# Altium schematic sheet Comms-Sheet.SchDoc
size 420 x 297 mm; SheetNumber: 3; SheetTotal: 5
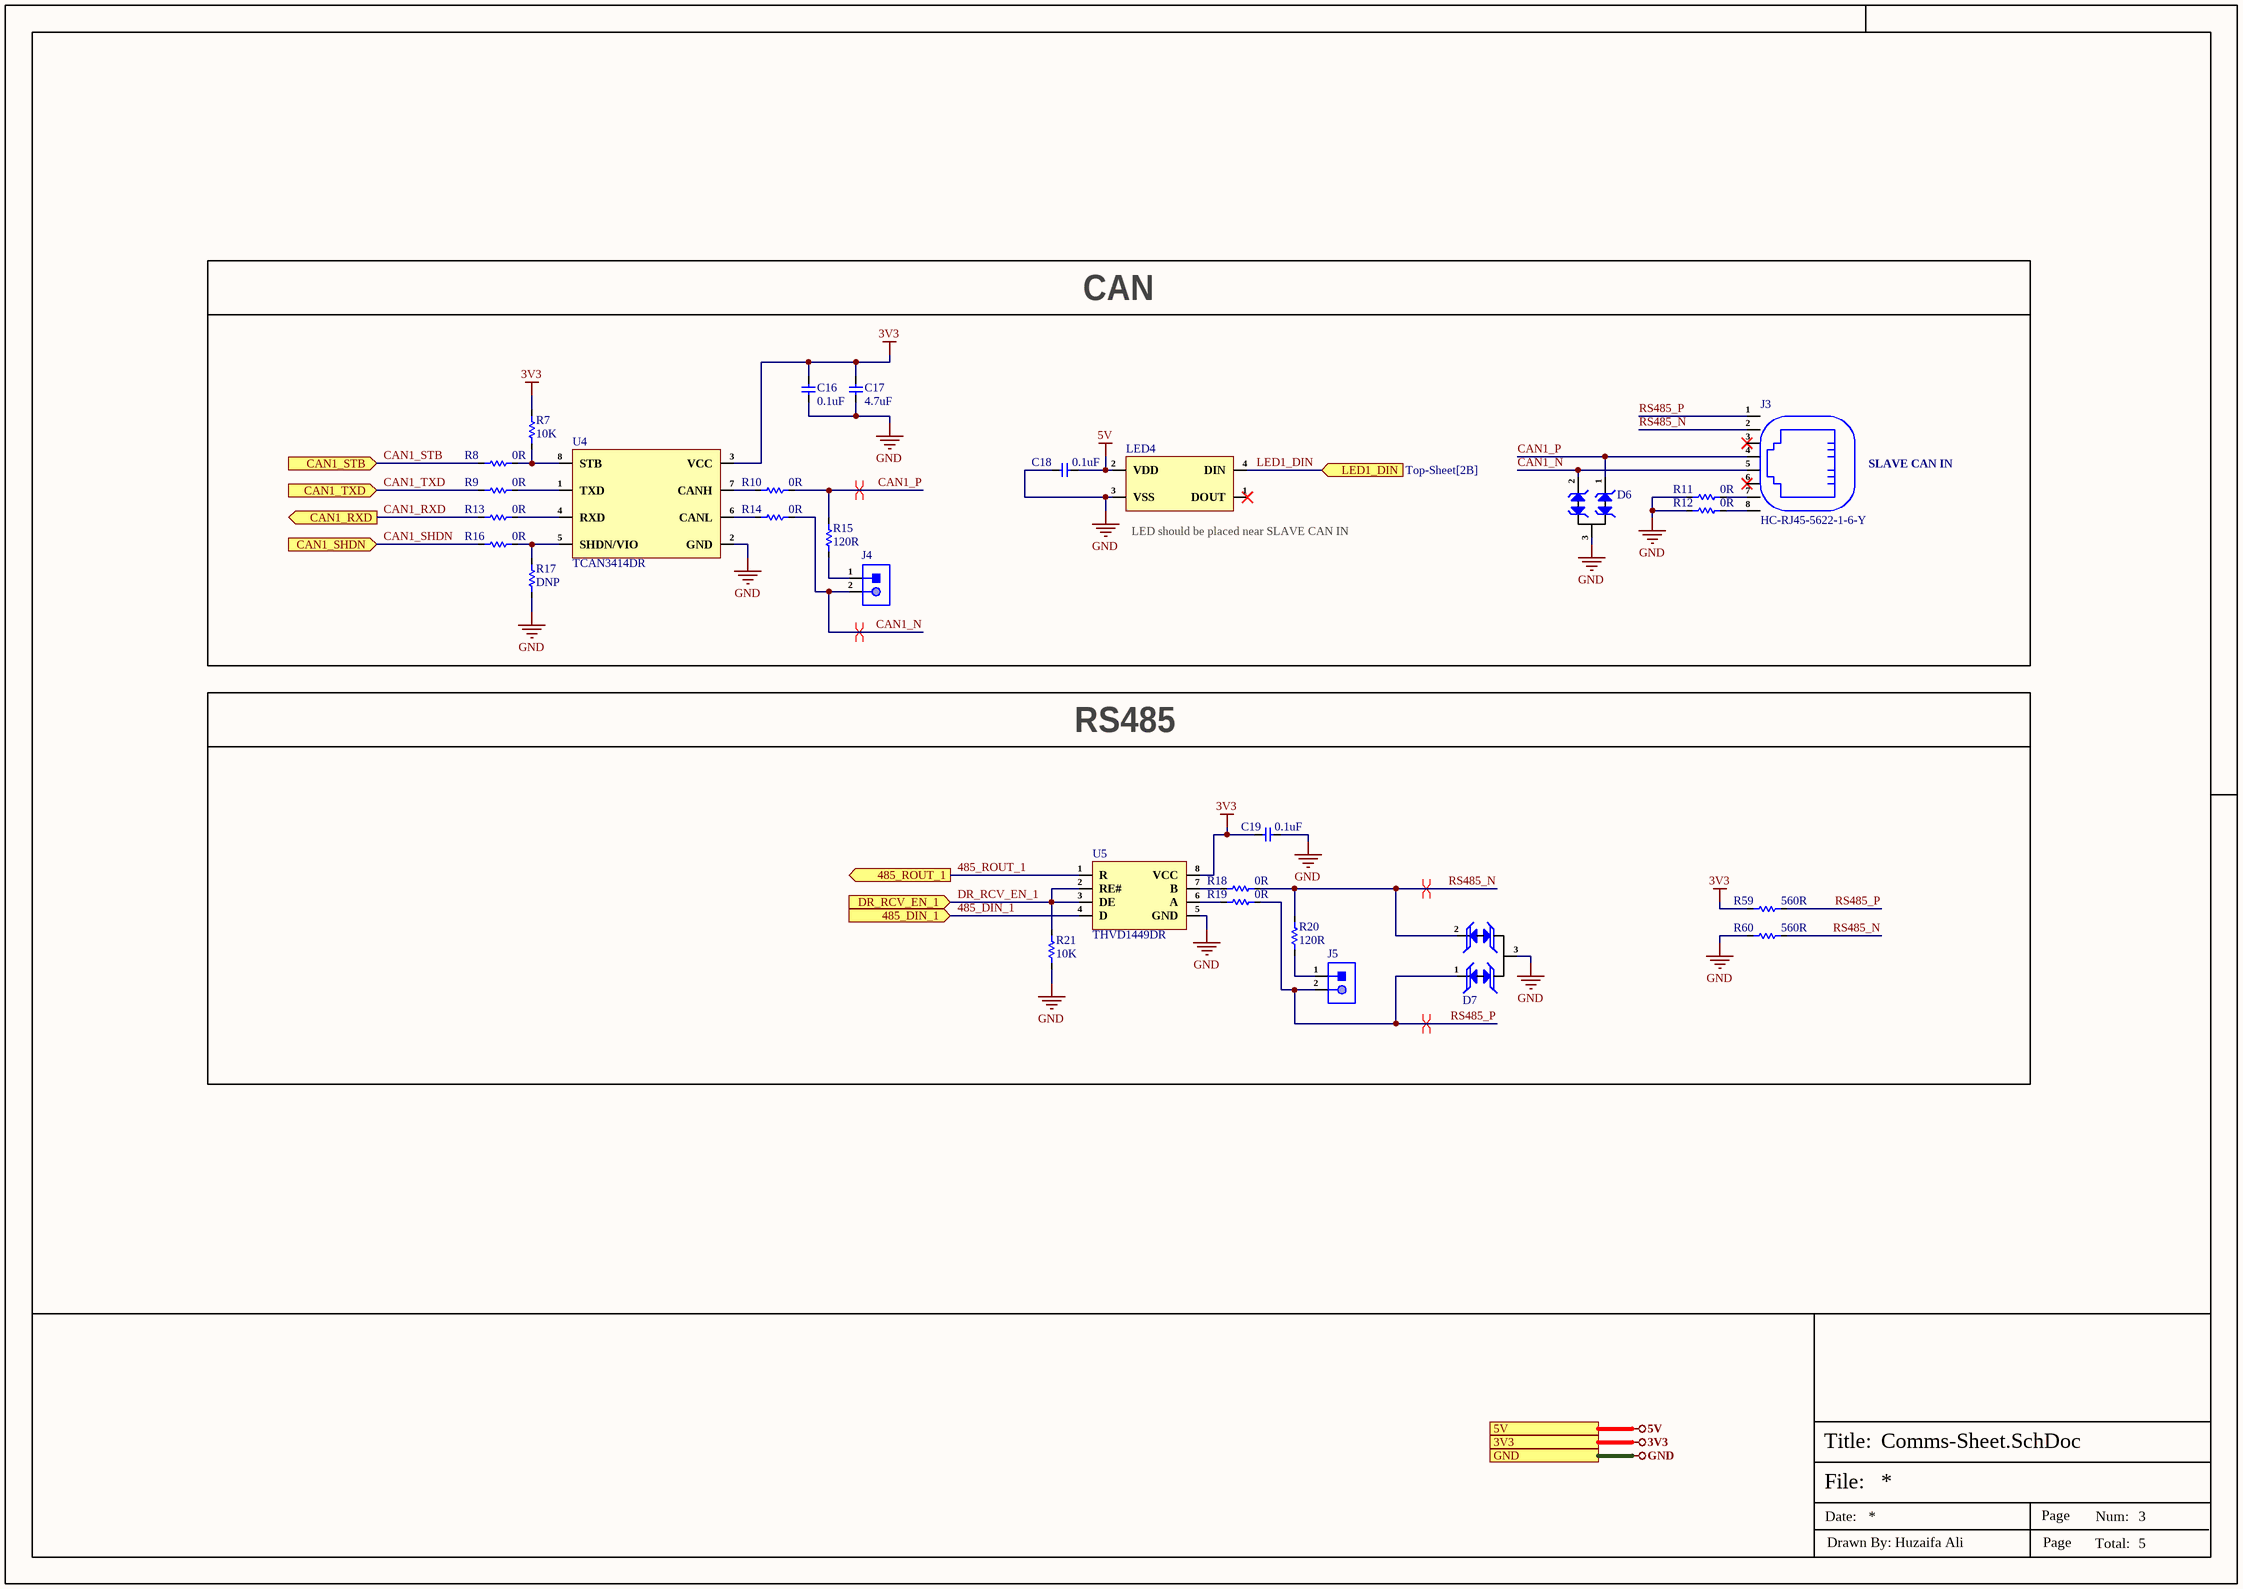
[diagram p0: Comms-Sheet.SchDoc]

## Parts
C16  0.1uF  [Cap-0402]
C17  4.7uF  [Cap-0402]
C18  0.1uF  [Cap-0402]
C19  0.1uF  [Cap-0402]
D6  CDSOT23-T24CAN-Q  [SOT-23]  (value not drawn)
D7  SM712  [SOT-23]  (value not drawn)
J3  HC-RJ45-5622-1-6-Y  [HC-RJ45-5622-1-6-Y]
J4  X6511WV-02H-C60D30  [HDR1X2_]  (value not drawn)
J5  X6511WV-02H-C60D30  [HDR1X2_]  (value not drawn)
LED4  WS2812D-F5  [WS2812D-F5]  (value not drawn)
R7  10K  [Res-0402]
R8  0R  [Res-0402]
R9  0R  [Res-0402]
R10  0R  [Res-0402]
R11  0R  [Res-0402]
R12  0R  [Res-0402]
R13  0R  [Res-0402]
R14  0R  [Res-0402]
R15  120R  [Res-0603]
R16  0R  [Res-0402]
R17  DNP  [Res-0402]
R18  0R  [Res-0402]
R19  0R  [Res-0402]
R20  120R  [Res-0603]
R21  10K  [Res-0402]
R59  560R  [Res-0402]
R60  560R  [Res-0402]
U4  TCAN3414DR  [SOIC-8(0.154", 3.90mm Width)]
U5  THVD1449DR  [SOIC-8(0.154", 3.90mm Width)]

## Blocks framed on the sheet
CAN: C16-C18 D6 J3 J4 LED4 R7-R17 U4
RS485: C19 D7 J5 R18-R21 R59 R60 U5

## Ports
3V3 (see Top-Sheet[2B], Controller-Sheet[4D], Power-Sheet[4D], Relay-10-Sheet[4D]), 5V (see Top-Sheet[2B], Controller-Sheet[4D], Power-Sheet[4D]), 485_DIN_1 (in, see Top-Sheet[2B]), 485_ROUT_1 (out, see Top-Sheet[2B]), CAN1_RXD (out, see Top-Sheet[2B]), CAN1_SHDN (in, see Top-Sheet[2B]), CAN1_STB (in, see Top-Sheet[2B]), CAN1_TXD (in, see Top-Sheet[2B]), DR_RCV_EN_1 (in, see Top-Sheet[2B]), GND (see Top-Sheet[2B], Controller-Sheet[4D], Power-Sheet[4D], Relay-10-Sheet[4D]), LED1_DIN (in, see Top-Sheet[2B])

## Nets
3V3: C16.2 C17.2 C19.2 R7.2 R59.2 U4.3(VCC) U5.8(VCC) ; port 3V3
5V: C18.2 LED4.2(VDD) ; port 5V
GND: C16.1 C17.1 C18.1 C19.1 D6.3 D7.3(GND) LED4.3(VSS) R11.1 R12.1 R17.1 R21.2 R60.2 U4.2(GND) U5.5(GND) ; port GND
485_DIN_1: U5.4(D) ; port 485_DIN_1
485_ROUT_1: U5.1(R) ; port 485_ROUT_1
CAN1_N: D6.2 J3.5 J4.2 R14.2
CAN1_P: D6.1 J3.4 R10.2 R15.2
CAN1_RXD: R13.1 ; port CAN1_RXD
CAN1_SHDN: R16.1 ; port CAN1_SHDN
CAN1_STB: R8.1 ; port CAN1_STB
CAN1_TXD: R9.1 ; port CAN1_TXD
DR_RCV_EN_1: R21.1 U5.2(RE#) U5.3(DE) ; port DR_RCV_EN_1
LED1_DIN: LED4.4(DIN) ; port LED1_DIN
RS485_N: D7.2(I/O2) J3.2 R18.2 R20.2 R60.1
RS485_P: D7.1(I/O1) J3.1 J5.2 R19.2 R59.1
NetJ3_7: J3.7 R11.2
NetJ3_8: J3.8 R12.2
NetJ4_1: J4.1 R15.1
NetJ5_1: J5.1 R20.1
NetR7_1: R7.1 R8.2 U4.8(STB)
NetR9_2: R9.2 U4.1(TXD)
NetR10_1: R10.1 U4.7(CANH)
NetR13_2: R13.2 U4.4(RXD)
NetR14_1: R14.1 U4.6(CANL)
NetR16_2: R16.2 R17.2 U4.5(SHDN/VIO)
NetR18_1: R18.1 U5.7(B)
NetR19_1: R19.1 U5.6(A)

Not connected (* = marked no-connect by the designer): J3 3* 6*; LED4 1(DOUT)*

## Layout directives
differential pair; differential pair class DIFF_RS485: RS485_N, RS485_P
differential pair; differential pair class DIFF_CAN: CAN1_N, CAN1_P

## Notes on the sheet
- SLAVE CAN IN
- (near LED4) LED should be placed near SLAVE CAN IN
- File:
- Title:
- Date:
- Page
- Num:
- Total:
- Drawn By: Huzaifa Ali

## Library data of the parts
C16 C18 C19 = CC0402JRX7R7BB104: CAP CER 0.1UF 16V X7R 0402; Manufacturer: Yageo; Material: 4241ConductorMaterial; Value: 100nF; Tolerance: 5%; Item Type: Capacitor; Supplier: Digikey; Supplier Part Number: 311-1676-1-ND; Manufacturer Part Number: CC0402JRX7R7BB104; RoHS: Yes; Category: Ceramic Capacitors; Stock: 1659111; Pricing: 1=0.1, 10=0.046, 50=0.0262, 100=0.0203, 500=0.01528, 1000=0.012, 2500=0.01091, 5000=0.01004 (USD); Mounting Technology: Surface Mount; Case/Package: 0402; Case Code (Metric): 1005; Case Code (Imperial): 0402; Min Operating Temperature: -55°C; Max Operating Temperature: 125°C; Dielectric: X7R; Packaging: Tape and Reel; Package Quantity: 10000; Voltage Rating (DC): 16V; Voltage Rating: 16V; Series: CC; Construction: Flat; Length: 0.039inch; Width: 0.02inch; Height: 0.5mm; Thickness: 0.022inch; Lead Free: Lead Free; Halogen Free: Halogen Free; RoHS Compliant: Yes; ComponentLink1URL: https://datasheet.ciiva.com/13210/upy-gphc-x7r-6-3v-to-50v-8-12304-13210152.pdf?src-supplier=Mouser; ComponentLink1Description: https://datasheet.ciiva.com/13210/upy-gphc-x7r-6-3v-to-50v-8-12304-13210152.pdf?src-supplier=Mouser; LCSC Part Number: C541464
C17 = CC0402KRX5R6BB475: CAP CER 4.7UF 10V X5R 0402; Manufacturer: Yageo; Tolerance: 10%; Supplier 1: Farnell; Manufacturer Part Number: CC0402KRX5R6BB475; RoHS: Yes; Category: Ceramic Capacitors; Stock 1: 20000; Pricing 1: 10000=0.02310, 50000=0.02100 (GBP); Mount: Surface Mount; Case/Package: 0402; Case Code (Imperial): 0402; Case Code (Metric): 1005; Min Operating Temperature: -55°C; Max Operating Temperature: 85°C; Packaging: Cut Tape; Capacitance: 4.7uF; Voltage Rating: 10V; RoHS Compliant: Yes; ComponentLink1URL: http://www.yageo.com/documents/recent/UPY-GPHC_X5R_4V-to-50V_25.pdf?src-supplier=Digi-Key; ComponentLink1Description: http://www.yageo.com/documents/recent/UPY-GPHC_X5R_4V-to-50V_25.pdf?src-supplier=Digi-Key; Supplier Part Number 1: 3871698; LCSC Part Number: C326586
D6 = CDSOT23-T24CAN-Q: TVS DIODE 24VWM 40VC SOT23-3; Manufacturer: Bourns; Item Type: TVS Diodes; Supplier: Digikey; LCSC Part Number: C350941; Manufacturer Part Number: CDSOT23-T24CAN-Q; RoHS: Yes; Stock: 17231; Pricing: 1=0.36, 10=0.282, 100=0.1691, 500=0.15656, 1000=0.10645, 3000=0.098, 6000=0.09393, 9000=0.08454, 30000=0.08328, 75000=0.07827 (USD); RoHS Compliant: 5897YesNo; ComponentLink1URL: http://www.farnell.com/datasheets/2372435.pdf?src-supplier=Farnell; ComponentLink1Description: http://www.farnell.com/datasheets/2372435.pdf?src-supplier=Farnell; ComponentLink2URL: https://www.bourns.com/docs/Product-Datasheets/cdsot23-t24can-Q.pdf?src-supplier=Digikey; ComponentLink2Description: https://www.bourns.com/docs/Product-Datasheets/cdsot23-t24can-Q.pdf?src-supplier=Digikey; ComponentLink3URL: http://www.farnell.com/datasheets/2372435.pdf?src-supplier=Newark; ComponentLink3Description: http://www.farnell.com/datasheets/2372435.pdf?src-supplier=Newark
D7 = SM712: SOT-23 TVS ROHS; Manufacturer: TECH PUBLIC; Item Type: Diode; Manufacturer Part Number: SM712; Package: SOT-23; LCSC Part Number: C521963; ComponentLink1Description: LCSC; ComponentLink1URL: https://www.lcsc.com/product-detail/TVS_TECH-PUBLIC-SM712_C521963.html
J3 = HC-RJ45-5622-1-6-Y: RJ45Receptacle Unshielded 1 Bend-in Gold Phosphor Bronze Without LED Plugin Ethernet Connectors / Modular Connectors (RJ45 RJ11) ROHS; Manufacturer: HCTL; Manufacturer Part Number: HC-RJ45-5622-1-6-Y; Package: Custom; LCSC Part Number: C3000205; Item Type: Ethernet Connectors; ComponentLink1Description: LCSC; ComponentLink1URL: https://www.lcsc.com/product-detail/Ethernet-Connectors-Modular-Connectors-RJ45-RJ11_HCTL-HC-RJ45-5622-1-6-Y_C3000205.html
J4 J5 = X6511WV-02H-C60D30: Gold 250V 3A Straight Square Pins 2.5mm 2P 260℃ 6mm -40℃~+105℃ 3mm 2.54mm Plugin Black Brass 1x2P Plugin,P=2.54mm Pin Headers ROHS; Manufacturer: XKB; Item Type: Male Header; Manufacturer Part Number: X6511WV-02H-C60D30; Package: Plugin,P=2.54mm; LCSC Part Number: C706874; ComponentLink1Description: LCSC; ComponentLink1URL: https://www.lcsc.com/product-detail/Pin-Headers_XKB-Connectivity-X6511WV-02H-C60D30_C706874.html
LED4 = WS2812D-F5: Plugin,D=5mm RGB LEDs ROHS; Manufacturer: Worldsemi; Item Type: RGB LED; Manufacturer Part Number: WS2812D-F5; Package: Plugin,D=5mm; LCSC Part Number: C190565; ComponentLink1Description: LCSC; ComponentLink1URL: https://jlcpcb.com/partdetail/Worldsemi-WS2812DF5/C190565
R7 R17 R21 = RC0402FR-0710KL: RES 10K OHM 1% 1/16W 0402; Manufacturer: Yageo; Resistance: 10kR; Voltage Rating (DC): 50V; Temperature Coefficient: 100ppm/°C; Power Rating: 62.5mW; Max Power Dissipation: 63mW; Item Type: Resistor; Supplier 1: Mouser; Manufacturer Part Number: RC0402FR-0710KL; RoHS: Yes; Category: Chip SMD Resistors; Stock 1: 18648329; Pricing 1: 1=0.10000, 10=0.01400, 50=0.01400, 100=0.00500, 1000=0.00300, 10000=0.00200 (USD); Case/Package: 0402; Number of Pins: 2; Case Code (Imperial): 0402; Case Code (Metric): 1005; Min Operating Temperature: -55°C; Max Operating Temperature: 155°C; Resistor Type: Thick Film; Tolerance: 1%; Packaging: Tape and Reel; Voltage Rating: 50V; Termination: SMD/SMT; Working Voltage: 50V; Number of Terminations: 2; Features: Moisture Resistant; Series: RC; Resistance Tolerance: 1%; Construction: Rectangular; Length: 1mm; Width: 0.5mm; Height: 0.32mm; Depth: 0.5mm; Lead Pitch: 0.2mm; REACH SVHC: No SVHC; Lead Free: Lead Free; RoHS Compliant: Yes; Military Standard: Not; ComponentLink1URL: https://datasheet.ciiva.com/7660/38568-7660787.pdf?src-supplier=Element14; ComponentLink1Description: https://datasheet.ciiva.com/7660/38568-7660787.pdf?src-supplier=Element14; ComponentLink2URL: https://datasheet.ciiva.com/7849/1686128-7849814.pdf?src-supplier=Element14; ComponentLink2Description: https://datasheet.ciiva.com/7849/1686128-7849814.pdf?src-supplier=Element14; ComponentLink3URL: https://datasheet.ciiva.com/7983/1018594-7983486.pdf?src-supplier=Element14; ComponentLink3Description: https://datasheet.ciiva.com/7983/1018594-7983486.pdf?src-supplier=Element14; ComponentLink4URL: https://datasheet.ciiva.com/22747/1018594-22747512.pdf?src-supplier=Element14; ComponentLink4Description: https://datasheet.ciiva.com/22747/1018594-22747512.pdf?src-supplier=Element14; ComponentLink5URL: https://datasheet.ciiva.com/12667/pyu-rc0402-51-rohs-l-6-r-12667067.pdf?src-supplier=Mouser; ComponentLink5Description: https://datasheet.ciiva.com/12667/pyu-rc0402-51-rohs-l-6-r-12667067.pdf?src-supplier=Mouser; ComponentLink6URL: https://datasheet.ciiva.com/7849/1784430-7849813.pdf?src-supplier=Element14; ComponentLink6Description: https://datasheet.ciiva.com/7849/1784430-7849813.pdf?src-supplier=Element14; ComponentLink7URL: https://datasheet.ciiva.com/7849/1784430-7849815.pdf?src-supplier=Element14; ComponentLink7Description: https://datasheet.ciiva.com/7849/1784430-7849815.pdf?src-supplier=Element14; Supplier Part Number 1: 603-RC0402FR-0710KL; LCSC Part Number: C60490
R8-R14 R16 R18 R19 = RC0402FR-070RL: RES 0 OHM JUMPER 1/16W 0402; Manufacturer: Yageo; Item Type: Resistors; Tolerance: 1%; Power Rating: 62.5mW; Voltage Rating: 50V; Temperature Coefficient: 200ppm/°C; Max Power Dissipation: 63mW; Supplier 1: Mouser; Manufacturer Part Number: RC0402FR-070RL; RoHS: Yes; Stock 1: 8556842; Pricing 1: 1=0.10000, 10=0.01400, 50=0.01400, 100=0.00600, 1000=0.00300, 5000=0.00200, 10000=0.00100 (USD); Mount: Surface Mount; Case/Package: 0402; Contact Plating: Tin,Matte; Case Code (Imperial): 0402; Case Code (Metric): 1005; Size Code: 0402; Min Operating Temperature: -55°C; Max Operating Temperature: 155°C; Resistance: 0R; Resistor Type: Thick Film; Packaging: Tape and Reel; Termination: SMD/SMT; Features: Moisture Resistant; Series: RC; Number of Terminations: 2; Length: 1mm; Width: 0.5mm; Height: 0.35mm; Radiation Hardening: No; Lead Free: Lead Free; RoHS Compliant: Yes; ComponentLink1URL: https://datasheet.ciiva.com/8896/pyu-rc0402-51-rohs-l-6-8896149.pdf?src-supplier=Avnet; ComponentLink1Description: https://datasheet.ciiva.com/8896/pyu-rc0402-51-rohs-l-6-8896149.pdf?src-supplier=Avnet; ComponentLink2URL: https://datasheet.ciiva.com/16790/pyu-rc0402-51-rohs-l-6-r-16790444.pdf?src-supplier=Future+Electronics; ComponentLink2Description: https://datasheet.ciiva.com/16790/pyu-rc0402-51-rohs-l-6-r-16790444.pdf?src-supplier=Future+Electronics; Supplier Part Number 1: 603-RC0402FR-070RL; LCSC Part Number: C106231
R15 R20 = RC0603FR-07120RL: RES 120 OHM 1% 1/10W 0603; Manufacturer: Yageo; Temperature Coefficient: 100ppm/°C; Voltage Rating (DC): 50V; Power Rating: 100mW; Item Type: Resistor; Supplier 1: Digi-Key; Manufacturer Part Number: RC0603FR-07120RL; RoHS: Yes; Category: Chip SMD Resistors; Stock 1: 839061; Pricing 1: 1=0.10000, 10=0.02400, 100=0.00970, 1000=0.00436, 2500=0.00378 (USD); Case/Package: 0603; Number of Pins: 2; Case Code (Metric): 1608; Case Code (Imperial): 0603; Size Code: 0603; Min Operating Temperature: -55°C; Max Operating Temperature: 155°C; Resistance: 120R; Tolerance: 1%; Resistor Type: Thick Film; Packaging: Tape and Reel; Voltage Rating: 50V; Package Quantity: 1; Number of Terminations: 2; Termination: SMD/SMT; Max Power Dissipation: 100mW; Features: Moisture Resistant; Series: RC; Construction: Rectangular; Resistance Tolerance: 1%; Length: 1.6mm; Width: 0.031inch; Height: 0.022inch; Depth: 0.8mm; REACH SVHC: No SVHC; Lead Free: Lead Free; Military Standard: Not; RoHS Compliant: Yes; ComponentLink1URL: https://datasheet.ciiva.com/2553/pyu-r-int-thick-7-2553512.pdf?src-supplier=Digi-Key; ComponentLink1Description: https://datasheet.ciiva.com/2553/pyu-r-int-thick-7-2553512.pdf?src-supplier=Digi-Key; ComponentLink2URL: https://datasheet.ciiva.com/7746/443971-7746248.pdf?src-supplier=Element14; ComponentLink2Description: https://datasheet.ciiva.com/7746/443971-7746248.pdf?src-supplier=Element14; ComponentLink3URL: https://datasheet.ciiva.com/2553/pyu-r-int-thick-7-2553513.pdf?src-supplier=Digi-Key; ComponentLink3Description: https://datasheet.ciiva.com/2553/pyu-r-int-thick-7-2553513.pdf?src-supplier=Digi-Key; ComponentLink4URL: https://datasheet.ciiva.com/7746/443971-7746249.pdf?src-supplier=Element14; ComponentLink4Description: https://datasheet.ciiva.com/7746/443971-7746249.pdf?src-supplier=Element14; ComponentLink5URL: https://datasheet.ciiva.com/2553/pyu-r-int-thick-7-2553514.pdf?src-supplier=Digi-Key; ComponentLink5Description: https://datasheet.ciiva.com/2553/pyu-r-int-thick-7-2553514.pdf?src-supplier=Digi-Key; ComponentLink6URL: https://datasheet.ciiva.com/46395/443971-46395021.pdf?src-supplier=Element14; ComponentLink6Description: https://datasheet.ciiva.com/46395/443971-46395021.pdf?src-supplier=Element14; Supplier Part Number 1: 311-120HRCT-ND; LCSC Part Number: C114640
R59 R60 = RC0402FR-07560RL: RES 560 OHM 1% 1/16W 0402; Manufacturer: Yageo; Power Rating: 63mW; Temperature Coefficient: 100ppm/°C; Voltage Rating: 50V; Item Type: Resistor; Supplier: Future Electronics; Supplier Part Number: 8872046; Manufacturer Part Number: RC0402FR-07560RL; RoHS: Yes; Category: Chip SMD Resistors; Stock: 1360000; Pricing: 10000=0.0012, 100000=0.0011, 300000=0.0011, 1250000=0.001, 3000000=0.0009 (USD); Case/Package: 0402; Case Code (Metric): 1005; Case Code (Imperial): 0402; Min Operating Temperature: -55°C; Max Operating Temperature: 155°C; Tolerance: 1%; Packaging: Tape and Reel; Value: 560R; Package Quantity: 1; Resistor Type: Thick Film; Number of Terminations: 2; Termination: SMD/SMT; Max Power Dissipation: 63mW; Features: Moisture Resistant; Series: RC; Construction: Rectangular; Resistance Tolerance: 1%; Length: 1mm; Width: 0.02inch; Height: 0.016inch; Depth: 0.5mm; RoHS Compliant: Yes; Military Standard: Not; Lead Free: Lead Free; Reach SVHC Compliant: Unknown; ComponentLink1URL: https://datasheet.ciiva.com/2453/pyu-r-int-thick-7-2453458.pdf?src-supplier=Digikey; ComponentLink1Description: https://datasheet.ciiva.com/2453/pyu-r-int-thick-7-2453458.pdf?src-supplier=Digikey; ComponentLink2URL: https://datasheet.ciiva.com/2453/pyu-r-int-thick-7-2453459.pdf?src-supplier=Digikey; ComponentLink2Description: https://datasheet.ciiva.com/2453/pyu-r-int-thick-7-2453459.pdf?src-supplier=Digikey; ComponentLink3URL: https://datasheet.ciiva.com/2453/pyu-r-int-thick-7-2453457.pdf?src-supplier=Digikey; ComponentLink3Description: https://datasheet.ciiva.com/2453/pyu-r-int-thick-7-2453457.pdf?src-supplier=Digikey; ComponentLink4URL: https://datasheet.ciiva.com/12558/pyu-rc0402-51-rohs-l-6-r-8721-12558383.pdf?src-supplier=Mouser; ComponentLink4Description: https://datasheet.ciiva.com/12558/pyu-rc0402-51-rohs-l-6-r-8721-12558383.pdf?src-supplier=Mouser; ComponentLink5URL: https://datasheet.ciiva.com/7850/1018594-7850042.pdf?src-supplier=Element14; ComponentLink5Description: https://datasheet.ciiva.com/7850/1018594-7850042.pdf?src-supplier=Element14; ComponentLink6URL: https://datasheet.ciiva.com/7850/1018594-7850043.pdf?src-supplier=Element14; ComponentLink6Description: https://datasheet.ciiva.com/7850/1018594-7850043.pdf?src-supplier=Element14; LCSC Part Number: C163460
U4 = TCAN3414DR: IC TRANSCEIVER HALF 1/1 8SOIC; Manufacturer: Texas Instruments; Supplier: Mouser; LCSC Part Number: C22396693; Manufacturer Part Number: TCAN3414DR; RoHS: No; Item Type: IC; Stock: 201; Pricing: 1=1.55, 10=1.1, 50=1.1, 100=0.895, 1000=0.763, 10000=0.681 (USD); Case/Package: SOIC; Pins: 8; Length: 4.9mm; Width: 3.91mm; Height: 1.75mm; Thickness: 1.58mm
U5 = THVD1449DR: IC TRANSCEIVER HALF 1/1 8SOIC; Manufacturer: Texas Instruments; Supplier: Mouser; LCSC Part Number: C3235059; Manufacturer Part Number: THVD1449DR; RoHS: No; Item Type: IC; Stock: 7454; Pricing: 1=3.62, 10=2.51, 50=2.51, 100=2.27, 1000=2.02, 10000=1.95 (USD)